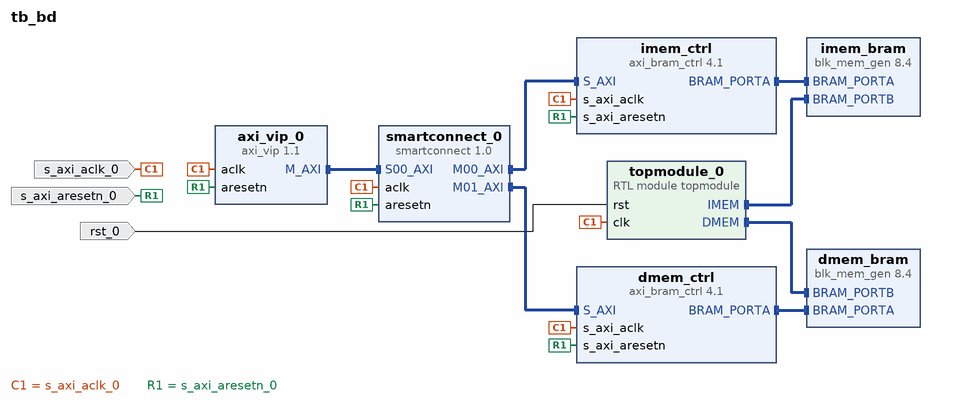
[diagram p0: block diagram of the top level]
# Vivado block design tb_bd, xc7z010clg400-1, Vivado 2026.1
create_bd_design tb_bd

create_bd_port -dir I -type clk s_axi_aclk_0
create_bd_port -dir I -type rst s_axi_aresetn_0
create_bd_port -dir I -type rst rst_0
set_property -dict {CONFIG.POLARITY ACTIVE_HIGH} [get_bd_ports rst_0]

create_bd_cell -type ip -vlnv xilinx.com:ip:axi_vip:1.1 axi_vip_0
set_property -dict [list \
  CONFIG.ADDR_WIDTH 32 \
  CONFIG.ARUSER_WIDTH 0 \
  CONFIG.AWUSER_WIDTH 0 \
  CONFIG.BUSER_WIDTH 0 \
  CONFIG.DATA_WIDTH 32 \
  CONFIG.HAS_BRESP 1 \
  CONFIG.HAS_BURST 1 \
  CONFIG.HAS_CACHE 1 \
  CONFIG.HAS_LOCK 1 \
  CONFIG.HAS_PROT 1 \
  CONFIG.HAS_QOS 1 \
  CONFIG.HAS_REGION 1 \
  CONFIG.HAS_RRESP 1 \
  CONFIG.HAS_WSTRB 1 \
  CONFIG.ID_WIDTH 0 \
  CONFIG.INTERFACE_MODE MASTER \
  CONFIG.PROTOCOL AXI4 \
  CONFIG.READ_WRITE_MODE READ_WRITE \
  CONFIG.RUSER_WIDTH 0 \
  CONFIG.SUPPORTS_NARROW 1 \
  CONFIG.WUSER_WIDTH 0 \
] [get_bd_cells axi_vip_0]
create_bd_cell -type ip -vlnv xilinx.com:ip:axi_bram_ctrl:4.1 imem_ctrl
set_property -dict {CONFIG.SINGLE_PORT_BRAM 1} [get_bd_cells imem_ctrl]
create_bd_cell -type ip -vlnv xilinx.com:ip:blk_mem_gen:8.4 imem_bram
set_property -dict {CONFIG.Memory_Type True_Dual_Port_RAM} [get_bd_cells imem_bram]
create_bd_cell -type module -reference topmodule topmodule_0
create_bd_cell -type ip -vlnv xilinx.com:ip:blk_mem_gen:8.4 dmem_bram
set_property -dict {CONFIG.Memory_Type True_Dual_Port_RAM} [get_bd_cells dmem_bram]
create_bd_cell -type ip -vlnv xilinx.com:ip:axi_bram_ctrl:4.1 dmem_ctrl
set_property -dict {CONFIG.SINGLE_PORT_BRAM 1} [get_bd_cells dmem_ctrl]
create_bd_cell -type ip -vlnv xilinx.com:ip:smartconnect:1.0 smartconnect_0
set_property -dict {CONFIG.NUM_MI 2 CONFIG.NUM_SI 1} [get_bd_cells smartconnect_0]

# ---- connections ----

connect_bd_intf_net [get_bd_intf_pins smartconnect_0/S00_AXI] [get_bd_intf_pins axi_vip_0/M_AXI]
connect_bd_intf_net [get_bd_intf_pins dmem_ctrl/BRAM_PORTA] [get_bd_intf_pins dmem_bram/BRAM_PORTA]
connect_bd_intf_net [get_bd_intf_pins imem_ctrl/BRAM_PORTA] [get_bd_intf_pins imem_bram/BRAM_PORTA]
connect_bd_intf_net [get_bd_intf_pins imem_ctrl/S_AXI] [get_bd_intf_pins smartconnect_0/M00_AXI]
connect_bd_intf_net [get_bd_intf_pins dmem_ctrl/S_AXI] [get_bd_intf_pins smartconnect_0/M01_AXI]
connect_bd_intf_net [get_bd_intf_pins dmem_bram/BRAM_PORTB] [get_bd_intf_pins topmodule_0/DMEM]
connect_bd_intf_net [get_bd_intf_pins imem_bram/BRAM_PORTB] [get_bd_intf_pins topmodule_0/IMEM]
connect_bd_net -net rst_0_1 [get_bd_ports rst_0] [get_bd_pins topmodule_0/rst]
connect_bd_net -net s_axi_aclk_0_1 [get_bd_ports s_axi_aclk_0] \
  [get_bd_pins imem_ctrl/s_axi_aclk] [get_bd_pins smartconnect_0/aclk] [get_bd_pins axi_vip_0/aclk] \
  [get_bd_pins dmem_ctrl/s_axi_aclk] [get_bd_pins topmodule_0/clk]
connect_bd_net -net s_axi_aresetn_0_1 [get_bd_ports s_axi_aresetn_0] \
  [get_bd_pins imem_ctrl/s_axi_aresetn] [get_bd_pins dmem_ctrl/s_axi_aresetn] [get_bd_pins axi_vip_0/aresetn] \
  [get_bd_pins smartconnect_0/aresetn]

# ---- address map ----
assign_bd_address -offset 0xC0008000 -range 32K -target_address_space [get_bd_addr_spaces axi_vip_0/Master_AXI] [get_bd_addr_segs imem_ctrl/S_AXI/Mem0]
assign_bd_address -offset 0xC2000000 -range 32K -target_address_space [get_bd_addr_spaces axi_vip_0/Master_AXI] [get_bd_addr_segs dmem_ctrl/S_AXI/Mem0]

validate_bd_design
save_bd_design
